# Altium schematic sheet CrankAndCam.SchDoc: Rotação e fase (CKP / CMP)
size 420 x 297 mm; Author: Matheus Markies; DrawnBy: Matheus Markies; Engineer: Matheus Markies; DocumentNumber: ECTU-SCH-05; Revision: A definir; SheetNumber: 5; SheetTotal: 12; ProjectTitle: ROUTE ECU / ECTU; DocumentStatus: Em desenvolvimento; DocumentDate: 14/10/2026
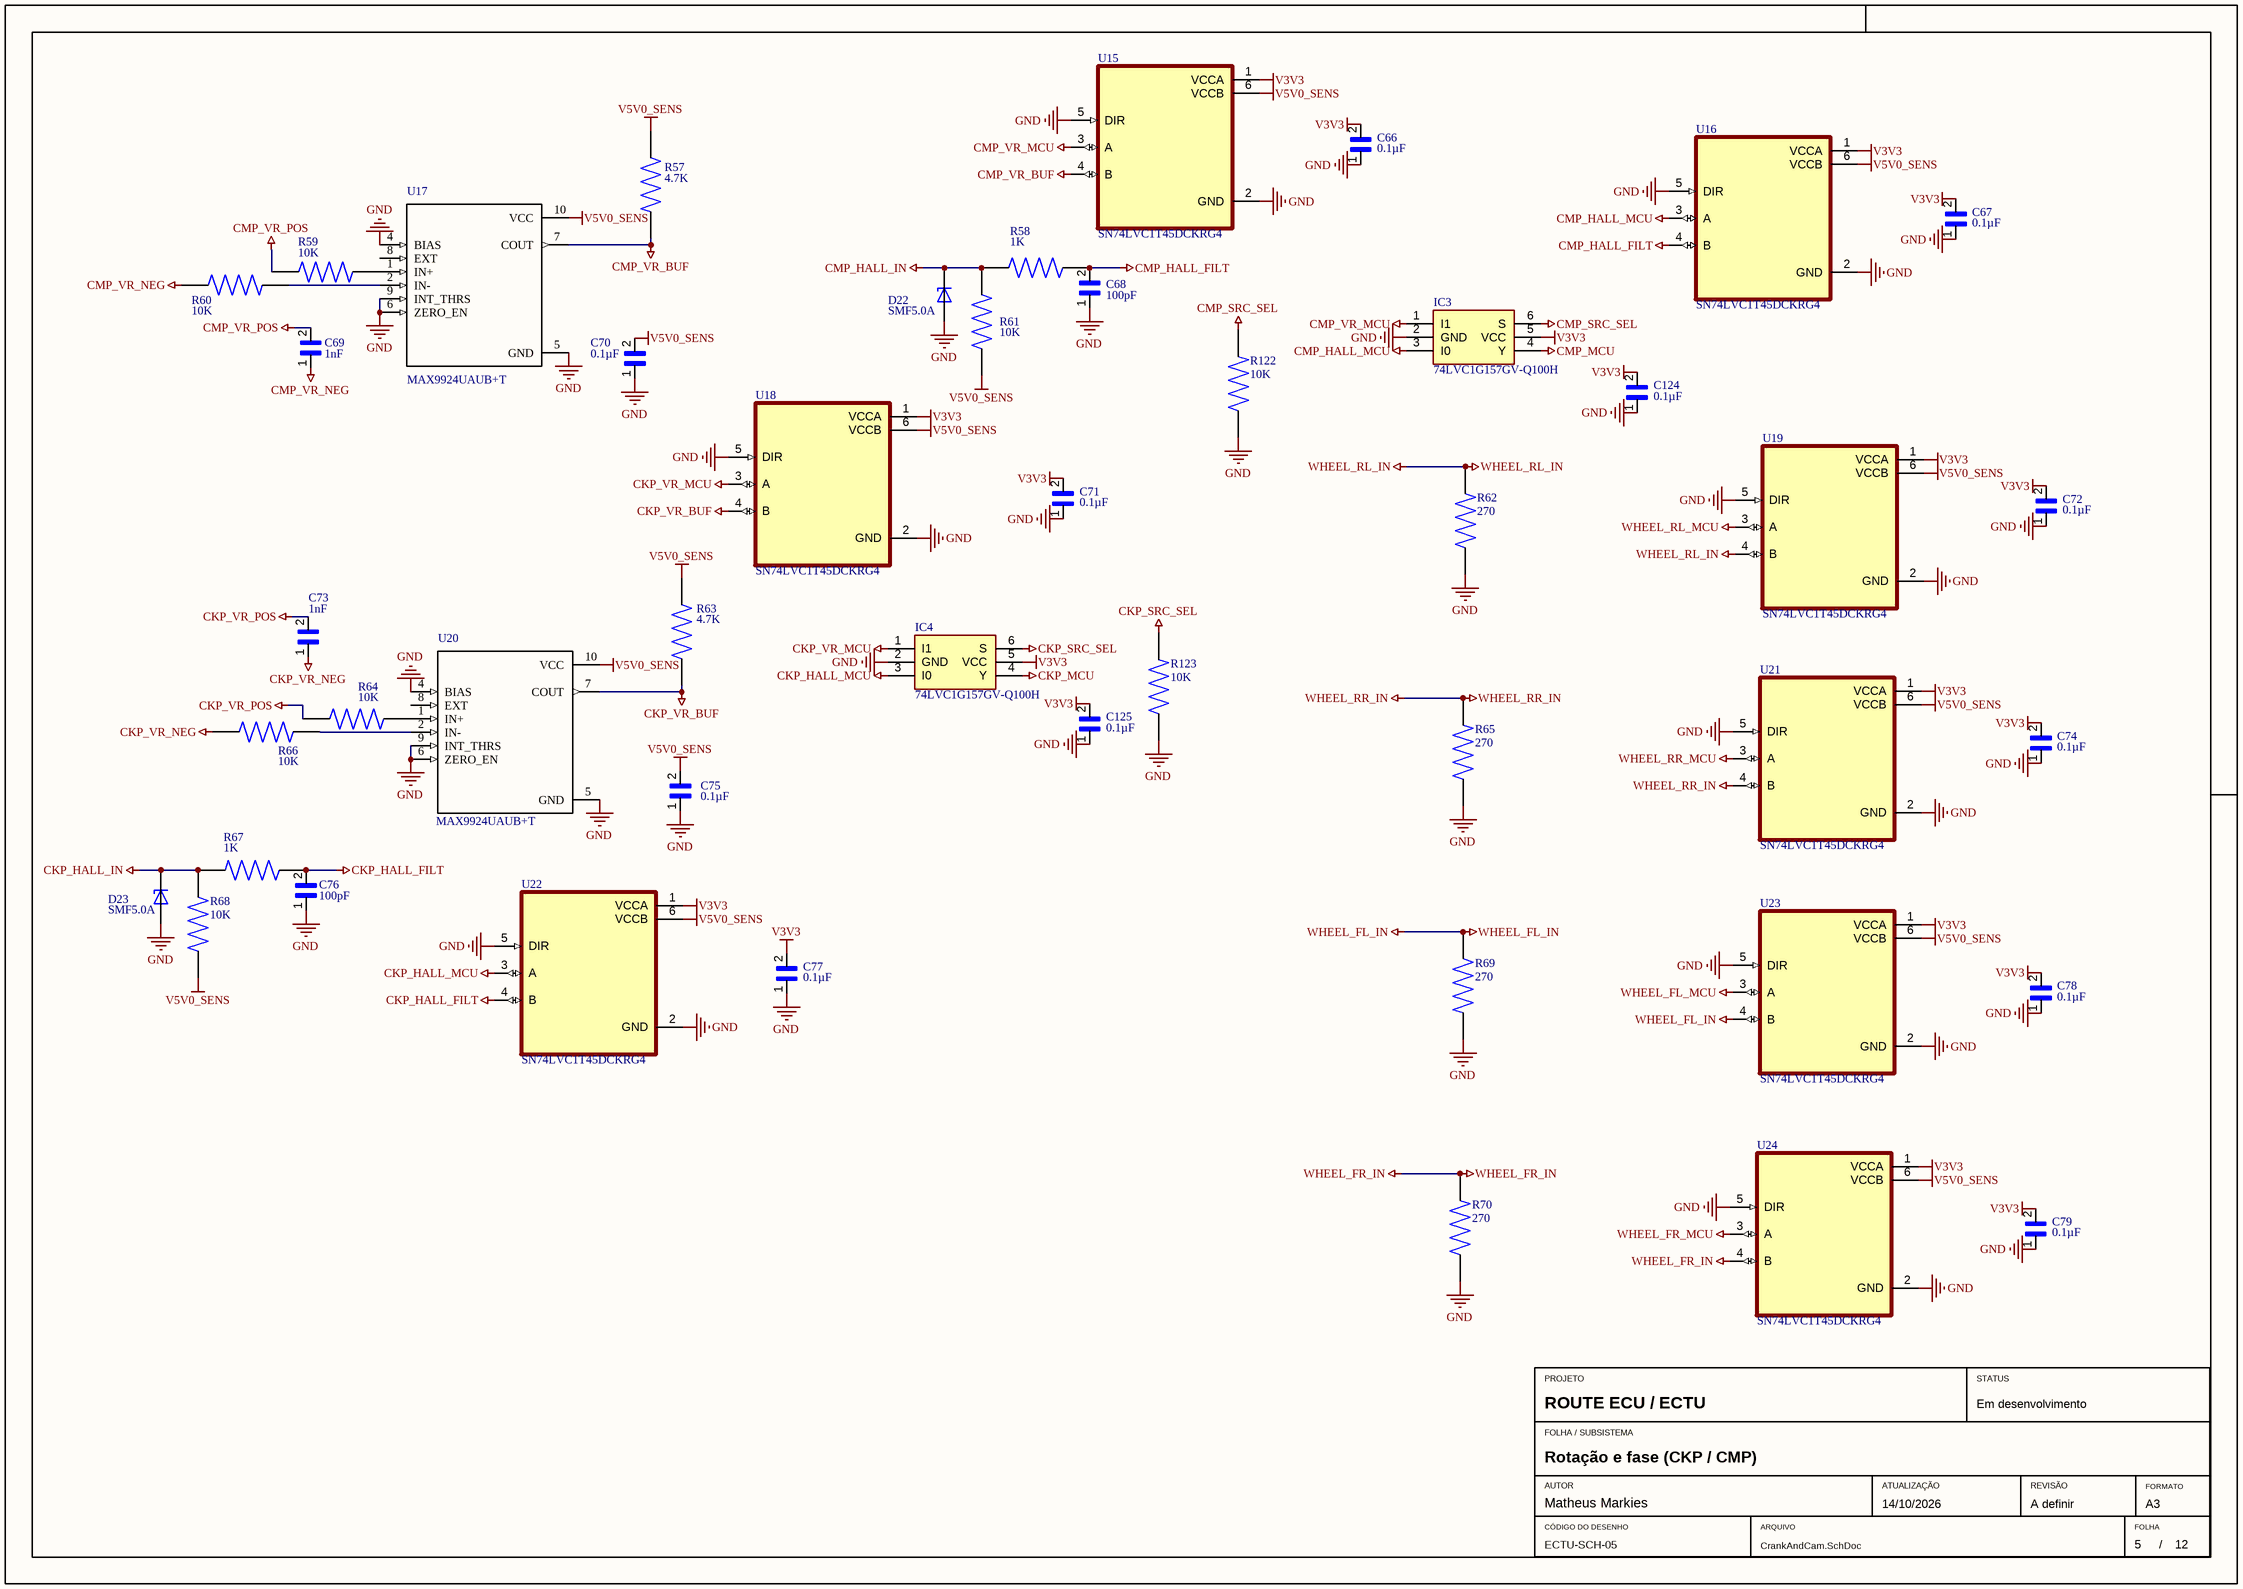
[diagram p0: CrankAndCam.SchDoc]

## Parts
C66  0.1µF  [CAPC1608X90N]
C67  0.1µF  [CAPC1608X90N]
C68  100pF  [CAPC1608X90N]
C69  1nF  [CAPC1608X90N]
C70  0.1µF  [CAPC1608X90N]
C71  0.1µF  [CAPC1608X90N]
C72  0.1µF  [CAPC1608X90N]
C73  1nF  [CAPC1608X90N]
C74  0.1µF  [CAPC1608X90N]
C75  0.1µF  [CAPC1608X90N]
C76  100pF  [CAPC1608X90N]
C77  0.1µF  [CAPC1608X90N]
C78  0.1µF  [CAPC1608X90N]
C79  0.1µF  [CAPC1608X90N]
C124  0.1µF  [CAPC1608X90N]
C125  0.1µF  [CAPC1608X90N]
D22  SMF5.0A  [SODFL3718X102N]
D23  SMF5.0A  [SODFL3718X102N]
IC3  74LVC1G157GV-Q100H  [SOT95P275X110-6N]
IC4  74LVC1G157GV-Q100H  [SOT95P275X110-6N]
R57  4.7K  [RESC3116X65N]
R58  1K  [RESC3116X65N]
R59  10K  [RESC3116X65N]
R60  10K  [RESC3116X65N]
R61  10K  [RESC3116X65N]
R62  270  [RESC3116X65N]
R63  4.7K  [RESC3116X65N]
R64  10K  [RESC3116X65N]
R65  270  [RESC3116X65N]
R66  10K  [RESC3116X65N]
R67  1K  [RESC3116X65N]
R68  10K  [RESC3116X65N]
R69  270  [RESC3116X65N]
R70  270  [RESC3116X65N]
R122  10K  [RESC3116X65N]
R123  10K  [RESC3116X65N]
U15  SN74LVC1T45DCKRG4  [SOT65P210X110-6N]
U16  SN74LVC1T45DCKRG4  [SOT65P210X110-6N]
U17  MAX9924UAUB+T  [*SOP50P490X110-10N]
U18  SN74LVC1T45DCKRG4  [SOT65P210X110-6N]
U19  SN74LVC1T45DCKRG4  [SOT65P210X110-6N]
U20  MAX9924UAUB+T  [*SOP50P490X110-10N]
U21  SN74LVC1T45DCKRG4  [SOT65P210X110-6N]
U22  SN74LVC1T45DCKRG4  [SOT65P210X110-6N]
U23  SN74LVC1T45DCKRG4  [SOT65P210X110-6N]
U24  SN74LVC1T45DCKRG4  [SOT65P210X110-6N]

## Nets
CKP_HALL_FILT: C76.2 R67.1 U22.4(B)
CKP_HALL_IN: D23.C R67.2 R68.2
CKP_HALL_MCU: IC4.3(I0) U22.3(A)
CKP_MCU: IC4.4(Y)
CKP_SRC_SEL: IC4.6(S) R123.2
CKP_VR_BUF: R63.1 U18.4(B) U20.7(COUT)
CKP_VR_MCU: IC4.1(I1) U18.3(A)
CKP_VR_NEG: C73.1 R66.1
CKP_VR_POS: C73.2 R64.1
CMP_HALL_FILT: C68.2 R58.1 U16.4(B)
CMP_HALL_IN: D22.C R58.2 R61.2
CMP_HALL_MCU: IC3.3(I0) U16.3(A)
CMP_MCU: IC3.4(Y)
CMP_SRC_SEL: IC3.6(S) R122.2
CMP_VR_BUF: R57.1 U15.4(B) U17.7(COUT)
CMP_VR_MCU: IC3.1(I1) U15.3(A)
CMP_VR_NEG: C69.1 R60.1
CMP_VR_POS: C69.2 R59.1
GND: C66.1 C67.1 C68.1 C70.1 C71.1 C72.1 C74.1 C75.1 C76.1 C77.1 C78.1 C79.1 C124.1 C125.1 D22.A D23.A IC3.2(GND) IC4.2(GND) R62.1 R65.1 R69.1 R70.1 R122.1 R123.1 U15.2(GND) U15.5(DIR) U16.2(GND) U16.5(DIR) U17.4(BIAS) U17.5(GND) U17.6(ZERO_EN) U17.9(INT_THRS) U18.2(GND) U18.5(DIR) U19.2(GND) U19.5(DIR) U20.4(BIAS) U20.5(GND) U20.6(ZERO_EN) U20.9(INT_THRS) U21.2(GND) U21.5(DIR) U22.2(GND) U22.5(DIR) U23.2(GND) U23.5(DIR) U24.2(GND) U24.5(DIR)
V3V3: C66.2 C67.2 C71.2 C72.2 C74.2 C77.2 C78.2 C79.2 C124.2 C125.2 IC3.5(VCC) IC4.5(VCC) U15.1(VCCA) U16.1(VCCA) U18.1(VCCA) U19.1(VCCA) U21.1(VCCA) U22.1(VCCA) U23.1(VCCA) U24.1(VCCA)
V5V0_SENS: C70.2 C75.2 R57.2 R61.1 R63.2 R68.1 U15.6(VCCB) U16.6(VCCB) U17.10(VCC) U18.6(VCCB) U19.6(VCCB) U20.10(VCC) U21.6(VCCB) U22.6(VCCB) U23.6(VCCB) U24.6(VCCB)
WHEEL_FL_IN: R69.2 U23.4(B)
WHEEL_FL_MCU: U23.3(A)
WHEEL_FR_IN: R70.2 U24.4(B)
WHEEL_FR_MCU: U24.3(A)
WHEEL_RL_IN: R62.2 U19.4(B)
WHEEL_RL_MCU: U19.3(A)
WHEEL_RR_IN: R65.2 U21.4(B)
WHEEL_RR_MCU: U21.3(A)
NetR59_2: R59.2 U17.1(IN+)
NetR60_2: R60.2 U17.2(IN-)
NetR64_2: R64.2 U20.1(IN+)
NetR66_2: R66.2 U20.2(IN-)

Not connected (* = marked no-connect by the designer): U17 8(EXT); U20 8(EXT)

## Notes on the sheet
- PROJETO
- STATUS
- FOLHA / SUBSISTEMA
- AUTOR
- CÓDIGO DO DESENHO
- ARQUIVO
- ATUALIZAÇÃO
- REVISÃO
- FOLHA
- FORMATO
- A3
- /

## Library data of the parts
C66-C79 C124 C125 = 06035C104MAZ2A: Multilayer Ceramic Capacitors MLCC - SMD/SMT; Package: None; Price: None; Value: *; MP: 06035C104MAZ2A; Availability: Unavailable
D22 D23 = SMF5.0A: 200W, 6.7V, 5%, Unidirectional, TVS; MF: Taiwan Semiconductor; SnapEDA_Link: https://www.snapeda.com/parts/SMF5.0A/taiwan/view-part/?ref=snap; Package: SOD-123W-2 Taiwan Semiconductor; Value: *; MP: SMF5.0A; Check_prices: https://www.snapeda.com/parts/SMF5.0A/taiwan/view-part/?ref=eda
IC3 IC4 = 74LVC1G157GV-Q100H: Integrated Circuit; Manufacturer_Name: Nexperia; Datasheet Link: https://assets.nexperia.com/documents/data-sheet/74LVC1G157_Q100.pdf; Height: 1.1mm; Manufacturer_Part_Number: 74LVC1G157GV-Q100H; Mouser Part Number: 771-74LVC1G157GVQ100; Mouser Price/Stock: https://www.mouser.co.uk/ProductDetail/Nexperia/74LVC1G157GV-Q100H?qs=5XOdhvmYM0Nhlh6GR9ENlQ%3D%3D; Arrow Part Number: 74LVC1G157GV-Q100H; Arrow Price/Stock: https://www.arrow.com/en/products/74lvc1g157gv-q100h/nexperia?utm_currency=USD&region=nac
R57-R70 R122 R123 = AA1206JR-07470RL: Package: None; Price: None; Value: *; MP: AA1206JR-07470RL; Availability: Unavailable
U15 U16 U18 U19 U21-U24 = SN74LVC1T45DCKRG4: Single-Bit Dual-Supply Bus Transceiver with Configurable Voltage-Level Shifting and 3-State Outputs 6-SC70 -40 to 85; MF: Texas Instruments; SnapEDA_Link: https://www.snapeda.com/parts/SN74LVC1T45DCKRG4/Texas+Instruments/view-part/?ref=snap; Package: SOT-SC70-6 Texas Instruments; Value: *; MP: SN74LVC1T45DCKRG4; Check_prices: https://www.snapeda.com/parts/SN74LVC1T45DCKRG4/Texas+Instruments/view-part/?ref=eda
U17 U20 = MAX9924UAUB+T: SnapEDA_Link: https://www.snapeda.com/parts/MAX9924UAUB+T/Maxim+Integrated/view-part/?ref=snap; Check_prices: https://www.snapeda.com/parts/MAX9924UAUB+T/Maxim+Integrated/view-part/?ref=eda; Value: *